# Altium schematic sheet Top.SchDoc
size B; SheetNumber: 1; SheetTotal: 4
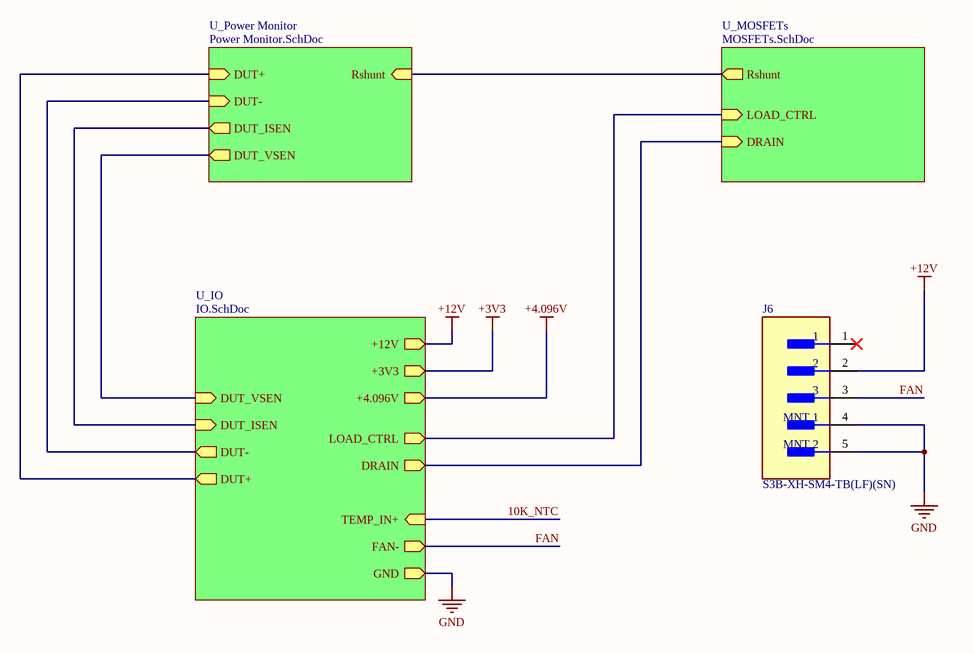
[diagram p0: Top.SchDoc]

## Parts
J6  S3B-XH-SM4-TB(LF)(SN)  [FP-S3B-XH-SM4-TB_LF_SN-MFG]

## Sub-sheets
U_IO = IO.SchDoc: DRAIN (out), DUT+ (out), DUT- (out), DUT_VSEN (in), DUT_ISEN (in), LOAD_CTRL (out), FAN- (out), TEMP_IN+ (in), +4.096V (out), +3V3 (out), +12V (out), GND (out)
U_MOSFETs = MOSFETs.SchDoc: DRAIN (in), LOAD_CTRL (in), Rshunt (out)
U_Power Monitor = Power Monitor.SchDoc: DUT+ (in), DUT- (in), DUT_VSEN (out), DUT_ISEN (out), Rshunt (in)

## Nets
+3V3: sheet U_IO/+3V3
+4.096V: sheet U_IO/+4.096V
+12V: J6.2 ; sheet U_IO/+12V
GND: J6.4(MNT_1) J6.5(MNT_2) ; sheet U_IO/GND
10K_NTC: sheet U_IO/TEMP_IN+
FAN: J6.3 ; sheet U_IO/FAN-
(unnamed): sheet U_IO/DRAIN, sheet U_MOSFETs/DRAIN
(unnamed): sheet U_IO/DUT+, sheet U_Power Monitor/DUT+
(unnamed): sheet U_IO/DUT-, sheet U_Power Monitor/DUT-
(unnamed): sheet U_IO/DUT_VSEN, sheet U_Power Monitor/DUT_VSEN
(unnamed): sheet U_IO/DUT_ISEN, sheet U_Power Monitor/DUT_ISEN
(unnamed): sheet U_IO/LOAD_CTRL, sheet U_MOSFETs/LOAD_CTRL
(unnamed): sheet U_Power Monitor/Rshunt, sheet U_MOSFETs/Rshunt

Not connected (* = marked no-connect by the designer): J6 1*

## Library data of the parts
J6 = CMP-17439-000066-1: CONN HEADER SMD R/A 3POS 2.5MM; Number of Positions: 3; Max Current Rating: 3A; Gender: Male; Max Voltage Rating (AC): 250V; Contact Resistance: 20mR; Connector Type: Male Pin; Max Operating Temperature: 85°C; Orientation: Right Angle; Series: XH; Number of Rows: 1; Housing Material: Polyamide; Packaging: Tape and Reel; Number of Contacts: 3; REACH SVHC: No SVHC; Housing Color: Beige; Mount: Surface Mount; Contact Material: Copper Alloy; Package Quantity: 1; Color: Natural; Min Operating Temperature: -25°C; Termination: Solder; Fastening Type: Detent; Pitch: 2.5mm; Lead Free: Lead Free; Length: 12.5mm; Depth: 10mm; Contact Plating: Tin; Contact Type: Male Pin